# EasyEDA Pro project ProPrj_Resona_2026-08-17.epro, board ESP32-S3-N16R8_1
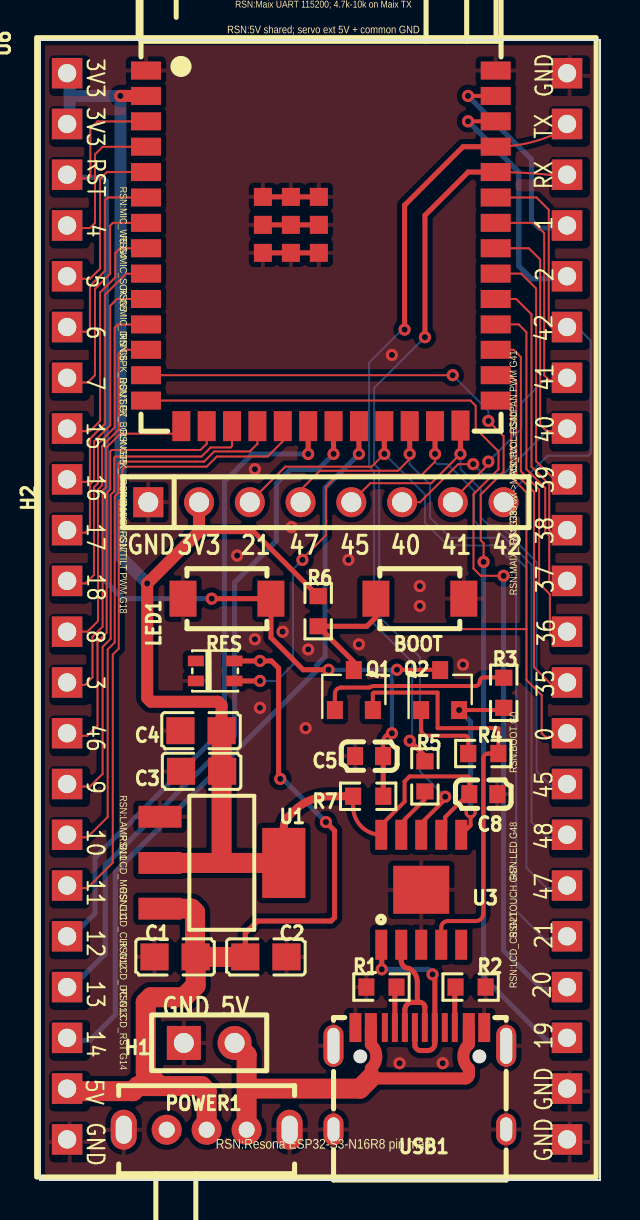
[diagram p2: board, top side]
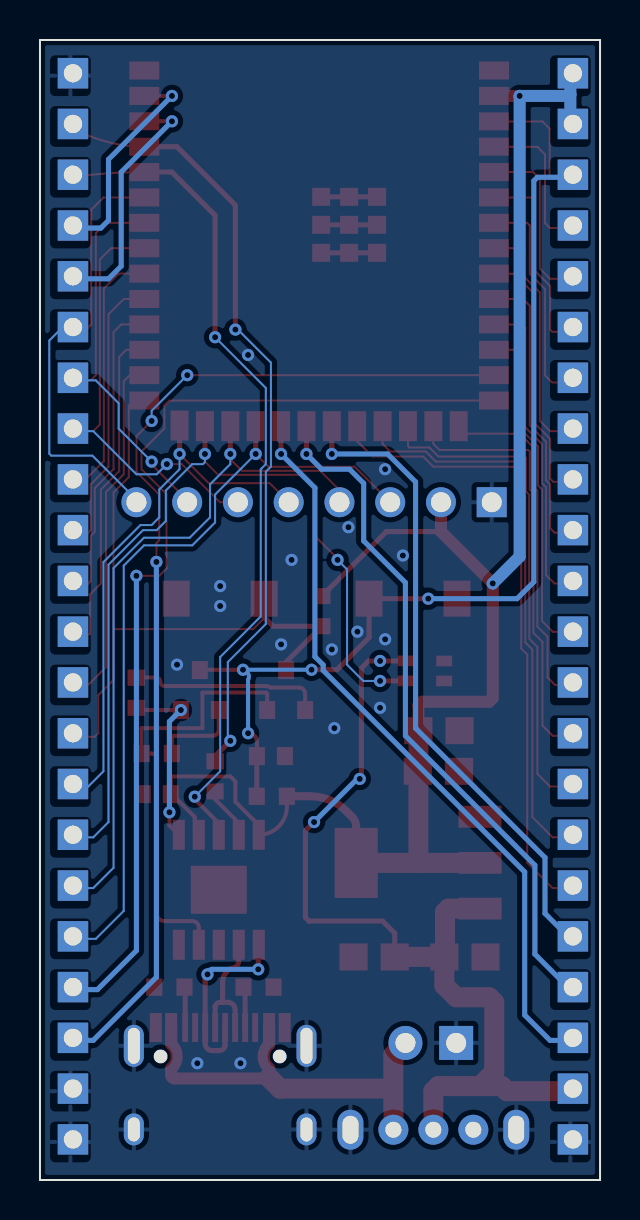
[diagram p3: board, bottom side, seen from below]

Outline 28.03 x 57.03 mm; copper layers: Top Layer, Bottom Layer. Coordinates in mm from the lower left corner of the outline.
Outline path: 0,57.03 0,0 28.03,0 28.03,57.03 0,57.03
Stack: Top Layer 0.035mm / Dielectric1 1.51mm FR4 er 4.5 / Bottom Layer 0.035mm

## Design rules (mm)
spacing copperThickness1oz (default): track to track 0.102, other pairs 0.152 to 0.3
spacing copperThickness2oz: track to track 0.203, other pairs 0.152 to 0.3
spacing Plane_innerPlane: track to track 0.102, other pairs 0.152 to 0.3
spacing Copper_copperRegion: track to track 0.102, other pairs 0.152 to 0.3
track width copperThickness1oz (default): min 0.127, default 0.254, max 2.54
track width copperThickness2oz: min 0.203, default 0.254, max 2.54
differential pair differentialPair (default): width min 0.127, default 0.254, max 2.54; gap min 0.152, default 0.152
pour e602 uses Copper_copperRegion
pour e712 uses Copper_copperRegion

## Placement (name value [footprint] x y rotation side)
BOOT  TS-KG88C-ART25F  [SW-SMD_L4.0-W2.9-LS4.8_G]  19.01 29.08 0 top
C1  10u  [C0805]  6.76 11.16 0 top
C2  104  [C0805]  11.31 11.16 180 top
C3  10u  [C0805]  8.09 20.45 0 top
C4  104  [C0805]  8.06 22.48 0 top
C5  1uF  [C0603]  16.47 21.21 180 top
C8  100nF  [C0603]  22.19 19.3 180 top
H1  -  [HDR-TH_2P-P2.54-V-F]  8.47 6.86 0 top
H2  -  [HDR-TH_8P-P2.54-V-M]  14.31 33.91 0 top
LED1  WS2812-2020  [LED-SMD_L2.2-W2.0]  8.77 25.47 180 top
POWER1  -  [SK12D07VG3]  8.34 1.02 0 top
Q1  S8050  [SOT-23]  15.71 24.51 90 top
Q2  S8050  [SOT-23]  20.03 24.51 90 top
R1  5.1kΩ  [R0603]  17.09 9.65 180 top
R2  5.1kΩ  [R0603]  21.55 9.65 0 top
R3  4.7kΩ  [R0603]  23.21 24.38 90 top
R4  4.7kΩ  [R0603]  22.19 21.34 180 top
R5  4.7kΩ  [R0603]  19.26 20.19 270 top
R6  10kΩ  [R0603]  13.92 28.46 90 top
R7  10kΩ  [R0603]  16.43 19.2 180 top
RES  TS-KG88C-ART25F  [SW-SMD_L4.0-W2.9-LS4.8_G]  9.36 29.08 180 top
U1  AMS1117-3.3  [SOT-223_L6.5-W3.5-P2.30-LS7.0-BR]  9.1 15.88 180 top
U2  ESP32-S3-WROOM-1-N16  [WIRELM-SMD_ESP32-S3-WROOM-1]  14.06 46.61 0 top
U3  CH340K  [ESOP-10_L4.9-W3.9-P1.00-LS6.2-BL-EP]  19.08 14.52 0 top
U6  -  [ESP32-S3-WROOM-1]  -0.04 57.02 270 top
USB1  -  [USB-C-SMD_TYPEC-304-BCP16]  19.01 5.08 0 top

## Footprints (pads in the part's own frame, mm; a bottom-side part is the same pattern mirrored in y, then rotated)
C0603
  rect 0.8x0.9 smd: 1(-0.7,0) 2(0.7,0)
C0805
  rect 1.41x1.35 smd: 1(-1.03,0) 2(1.03,0)
ESOP-10_L4.9-W3.9-P1.00-LS6.2-BL-EP
  rect 0.6x1.5 smd: 1(-2,-2.75) 2(-1,-2.75) 3(0,-2.75) 4(1,-2.75) 5(2,-2.75) 6(2,2.75) 7(1,2.75) 8(0,2.75) 9(-1,2.75) 10(-2,2.75)
  rect 2.8x2.4 smd: 11(0,0)
ESP32-S3-WROOM-1
  rect 1.524x1.524 hole 0.914: 1(1.651,1.397) 2(4.191,1.397) 3(6.731,1.397) 4(9.271,1.397) 5(11.811,1.397) 6(14.351,1.397) 7(16.891,1.397) 8(19.431,1.397) 9(21.971,1.397) 10(24.511,1.397) 11(27.051,1.397) 12(29.591,1.397) 13(32.131,1.397) 14(34.671,1.397) 15(37.211,1.397) 16(39.751,1.397) 17(42.291,1.397) 18(44.831,1.397) 19(47.371,1.397) 20(49.911,1.397) 21(52.451,1.397) 22(54.991,1.397) 23(54.991,26.416) 24(52.451,26.416) 25(49.911,26.416) 26(47.371,26.416) 27(44.831,26.416) 28(42.291,26.416) 29(39.751,26.416) 30(37.211,26.416) 31(34.671,26.416) 32(32.131,26.416) 33(29.591,26.416) 34(27.051,26.416) 35(24.511,26.416) 36(21.971,26.416) 37(19.431,26.416) 38(16.891,26.416) 39(14.351,26.416) 40(11.811,26.416) 41(9.271,26.416) 42(6.731,26.416) 43(4.191,26.416) 44(1.651,26.416)
HDR-TH_2P-P2.54-V-F
  rect 1.7x1.7 hole 1: 1(-1.27,0)
  round 1.7 hole 1: 2(1.27,0)
HDR-TH_8P-P2.54-V-M
  rect 1.5x1.5 hole 1: 1(-8.89,0)
  round 1.5 hole 1: 2(-6.35,0) 3(-3.81,0) 4(-1.27,0) 5(1.27,0) 6(3.81,0) 7(6.35,0) 8(8.89,0)
LED-SMD_L2.2-W2.0
  rect 0.8x0.535 smd: 1(0.965,-0.5) 2(0.965,0.5) 3(-0.965,0.5) 4(-0.965,-0.5)
R0603
  rect 0.806x0.864 smd: 1(-0.753,0) 2(0.753,0)
SK12D07VG3
  round 1.5 hole 0.8: 1(-2,1.5) 2(0,1.5) 3(2,1.5)
  oval 1.3x2 hole 0.8x1.4: 4(4.15,1.5) 5(-4.15,1.5)
SOT-23
  rect 0.9x0.8 smd: 1(-1,0.95) 2(-1,-0.95) 3(1,0)
SOT-223_L6.5-W3.5-P2.30-LS7.0-BR
  rect 2.159x1.092 smd: 1(3.099,-2.299) 2(3.099,0.013) 3(3.099,2.299)
  rect 2.159x3.505 smd: 4(-3.099,0.013)
SW-SMD_L4.0-W2.9-LS4.8_G
  rect 1.35x1.8 smd: 1(-2.2,0) 2(2.2,0)
USB-C-SMD_TYPEC-304-BCP16
  oval 1.001x2.1 hole 0.6x1.801: 13(-4.321,1.633) 14(4.321,1.633)
  oval 1.001x1.6 hole 0.6x1.199: 15(-4.321,-2.547) 16(4.321,-2.547)
  rect 0.6x1.45 smd: A1B12(-3.226,2.547) A4B9(-2.451,2.547) B1A12(3.22,2.547) B4A9(2.451,2.547)
  rect 0.299x1.45 smd: A5(-1.25,2.547) A6(-0.249,2.547) A7(0.249,2.547) A8(1.25,2.547) B5(1.75,2.547) B6(0.75,2.547) B7(-0.75,2.547) B8(-1.75,2.547)
WIRELM-SMD_ESP32-S3-WROOM-1
  rect 1.5x0.9 smd: 1(-8.75,8.895) 2(-8.75,7.625) 3(-8.75,6.355) 4(-8.75,5.085) 5(-8.75,3.815) 6(-8.75,2.545) 7(-8.75,1.275) 8(-8.75,0.005) 9(-8.75,-1.265) 10(-8.75,-2.535) 11(-8.75,-3.805) 12(-8.75,-5.075) 13(-8.75,-6.345) 14(-8.75,-7.615) 27(8.75,-7.615) 28(8.75,-6.345) 29(8.75,-5.075) 30(8.75,-3.805) 31(8.75,-2.535) 32(8.75,-1.265) 33(8.75,0.005) 34(8.75,1.275) 35(8.75,2.545) 36(8.75,3.815) 37(8.75,5.085) 38(8.75,6.355) 39(8.75,7.625) 40(8.75,8.895)
  rect 0.9x1.5 smd: 15(-6.985,-8.895) 16(-5.715,-8.895) 17(-4.445,-8.895) 18(-3.175,-8.895) 19(-1.905,-8.895) 20(-0.635,-8.895) 21(0.635,-8.895) 22(1.905,-8.895) 23(3.175,-8.895) 24(4.445,-8.895) 25(5.715,-8.895) 26(6.985,-8.865)
  rect 0.9x0.9 smd: 41(-2.9,2.575) 41(-2.9,1.175) 41(-2.9,-0.225) 41(-1.5,2.575) 41(-1.5,1.175) 41(-1.5,-0.225) 41(-0.1,2.575) 41(-0.1,1.175) 41(-0.1,-0.225)

## Nets
3V3: C3.2 C4.2 C8.2 H2.2 R6.2 R7.2 U1.2 U1.4 U2.2 U3.7 U3.10 U6.1 U6.2
5V: C1.2 C2.2 LED1.4 POWER1.2 U1.3 U6.21
GND: BOOT.2 C1.1 C2.1 C3.1 C4.1 C5.2 C8.1 H1.1 H2.1 LED1.2 POWER1.4 POWER1.5 R1.2 R2.2 RES.2 U1.1 U2.1 U2.40 U2.41 U3.3 U3.11 U6.22 U6.23 U6.24 U6.44 USB1.13 USB1.14 USB1.15 USB1.16 USB1.A1B12 USB1.B1A12
VBUS: H1.2 POWER1.3 USB1.A4B9 USB1.B4A9
340_RX: R5.2 U3.9
340_TX: U2.36 U3.8 U6.42
BOOT: BOOT.1 Q1.3 R6.1 U2.27 U6.31
CC1: R1.1 USB1.A5
CC2: R2.1 USB1.B5
D+: U3.1 USB1.A6 USB1.B6
D-: U3.2 USB1.A7 USB1.B7
DTR: Q1.2 R4.1 U3.4
EN: C5.1 Q2.3 R7.1 RES.1 U2.3 U6.3
IO1: U2.39 U6.41
IO2: U2.38 U6.40
IO3: U2.15 U6.13
IO4: U2.4 U6.4
IO5: U2.5 U6.5
IO6: U2.6 U6.6
IO7: U2.7 U6.7
IO8: U2.12 U6.12
IO9: U2.17 U6.15
IO10: U2.18 U6.16
IO11: U2.19 U6.17
IO12: U2.20 U6.18
IO13: U2.21 U6.19
IO14: U2.22 U6.20
IO15: U2.8 U6.8
IO16: U2.9 U6.9
IO17: U2.10 U6.10
IO18: U2.11 U6.11
IO19: U2.13 U6.25
IO20: U2.14 U6.26
IO21: H2.3 U2.23 U6.27
IO35: U2.28 U6.32
IO36: U2.29 U6.33
IO37: U2.30 U6.34
IO38: U2.31 U6.35
IO39: U2.32 U6.36
IO40: H2.6 U2.33 U6.37
IO41: H2.7 U2.34 U6.38
IO42: H2.8 U2.35 U6.39
IO45: H2.5 U2.26 U6.30
IO46: U2.16 U6.14
IO47: H2.4 U2.24 U6.28
IO48: LED1.3 U2.25 U6.29
RTS: Q2.2 R3.1 U3.6
U0TX: R5.1 U2.37 U6.43
$1N1380: Q2.1 R4.2
$1N1381: Q1.1 R3.2

Pads without a net: LED1 1; POWER1 1; U3 5; USB1 A8 B8

## Via types
v1: diameter 0.61, hole 0.305, Top Layer to Bottom Layer, 50 vias

## Routing (per net, layer and track width the routed paths; a pad name or vN(x,y) marks a point on that pad's centre or on a via; arc(x,y) is an arc through that point)
3V3: length 86.1
  Top Layer w0.2: R7.2 15.67,18.68 arc(16.08,17.68) U3.10 17.08,17.76 18.25,18.93 18.25,19.94 18.5,20.19 21.42,20.19 21.49,20.13 C8.2 21.42,19.3 20.28,18.16 20.28,17.47 U3.7
  Top Layer w0.254: 7.96,32.44 10.69,32.44 R6.2
  Top Layer w0.4: U1.4 12.2,17.67 arc(12.26,17.94) 12.41,18.16 12.7,18.45 arc(13.52,19.01) 14.5,19.2 R7.2
  Top Layer w0.6: C4.2 9.09,23.75 8.91,23.93 5.55,23.93 5.37,24.11 v1(5.37,29.84) 7.96,32.44 H2.2 ; U2.2 v1(4.02,54.23)
  Top Layer w1: 9.09,15.86 C4.2 ; 9.09,15.86 6.01,15.86 ; 9.09,15.86 U1.4
  Bottom Layer w0.6: 1.48,54.31 1.56,54.23 v1(4.02,54.23) 4.02,31.19 v1(5.37,29.84) ; 1.48,54.31 1.48,55.25 ; 1.48,54.31 1.48,52.7
5V: length 46.1
  Top Layer w0.254: LED1.4 v1(11.01,25.97) 11.58,25.97 11.94,25.61 11.94,20.15 v1(12.03,20.07) ; C2.2 10.28,12.35 10.88,12.95 14.57,12.95 14.75,13.13 14.75,17.47 v1(14.31,17.91)
  Top Layer w1: C2.2 C1.2 7.79,9.73 7.2,9.14 5.55,9.14 5.29,8.89 5.29,5.41 6,4.7 ; 6,4.7 4.91,4.7 4.66,4.44 1.48,4.44 ; 6,4.7 8.09,4.7 8.34,4.44 POWER1.2 ; 7.83,11.43 7.76,11.5 7.76,13.4 7.58,13.58 6.01,13.58
  Bottom Layer w0.254: v1(14.31,17.91) 12.15,20.07 v1(12.03,20.07)
GND: length 8.4
  Top Layer w0.254: U2.41 U2.41 U2.41 ; U2.41 U2.41 U2.41 ; U2.41 U2.41 U2.41
  vias: v1(9.87,31.24) v1(10.76,35.56) v1(10.76,27.05) v1(11.01,23.62) v1(12.14,27.43) v1(12.59,32.66) v1(13.3,22.61) v1(13.42,26.54) v1(15.44,31.02) v1(15.96,26.8) v1(17.61,41.28) v1(17.99,5.84) v1(19.01,29.71) v1(19.01,28.72) v1(20.15,5.84) v1(21.17,25.78)
VBUS: length 21.2
  Top Layer w0.6: USB1.B4A9 21.46,6.79 arc(21.19,6.18) 21.46,5.58 21.46,5.25 arc(21.41,5.13) 21.3,5.08 16.6,5.08 arc(16.57,5.09) 16.56,5.12 16.56,5.58 arc(16.83,6.18) 16.56,6.79 USB1.A4B9
  Top Layer w1: 10.36,4.57 16.01,4.57 16.56,5.12 ; H1.2 10.34,6.25 POWER1.3
340_RX: length 2.7
  Top Layer w0.2: U3.9 18.25,17.44 18.25,18.03 19.26,19.05 R5.2
340_TX: length 42.2
  Top Layer w0.1: U2.36 arc(24.66,50.36) 26.5,50.17
  Top Layer w0.2: U3.8 19.21,17.4 19.21,17.98 20.28,19.05 v1(20.28,19.18)
  Top Layer w0.254: v1(19.26,42.16) 19.26,48.26 21.43,50.42 U2.36
  Bottom Layer w0.1: v1(19.26,42.16) 16.72,39.62 16.72,35.81 16.98,35.56 16.98,28.19 19.01,26.16 19.01,20.45 v1(20.28,19.18)
BOOT: length 34.1
  Top Layer w0.1: 24.34,27.56 24.34,25.02 25.11,24.26 25.11,22.35 25.29,22.17 26.45,22.17 26.5,22.22 ; 24.34,27.56 17.36,27.56 16.81,28.11 ; 24.34,27.56 24.34,34.4 23.58,35.17 23.58,38.73 23.32,38.99 U2.27
  Top Layer w0.254: BOOT.1 16.81,28.15 16.36,27.7 R6.1 15.71,25.92 Q1.3
CC1: length 2.1
  Top Layer w0.254: USB1.A5 17.76,9.57 arc(17.78,9.63) R1.1
CC2: length 2
  Top Layer w0.254: USB1.B5 20.76,9.62 arc(20.77,9.64) R2.1
D+: length 9.7
  Top Layer w0.254: v1(17.11,10.54) 17.11,11.75 arc(17.1,11.76) U3.1 ; 18.76,7.63 18.76,6.76 arc(18.85,6.56) 19.05,6.48 19.41,6.48 arc(19.66,6.58) 19.76,6.82 USB1.B6 19.76,10.17 arc(19.73,10.25) v1(19.65,10.29)
  Bottom Layer w0.254: v1(17.11,10.54) 19.39,10.54 arc(19.57,10.47) v1(19.65,10.29)
D-: length 6.6
  Top Layer w0.254: USB1.B7 18.26,8.52 arc(18.37,8.78) 18.63,8.89 18.89,8.89 ; 18.89,8.89 18.89,9.9 arc(18.77,10.3) 18.47,10.59 arc(18.35,10.6) 18.24,10.66 arc(18.12,10.8) 18.08,10.97 U3.2 ; 18.89,8.89 19.01,8.89 arc(19.17,8.83) 19.26,8.69 ; USB1.A7 19.26,8.69 ; 19.26,8.69 arc(19.26,8.66) 19.26,8.64
DTR: length 22.2
  Top Layer w0.2: U3.4 20.08,12.63 arc(20.18,12.86) 20.41,12.95 21.8,12.95 arc(22.07,13.07) 22.19,13.33 22.19,21.08 arc(22.26,21.26) 22.44,21.34 R4.1 arc(22.95,21.34) 22.95,21.34 22.95,22.61 19.9,22.61 19.9,24.38 16.72,24.38 arc(16.68,24.36) 16.66,24.32 Q1.2
EN: length 54.8
  Top Layer w0.1: U2.3 5.3,52.96 2.88,52.96 2.52,52.6 2.52,50.21 2.42,50.11 1.54,50.11 1.48,50.17
  Top Layer w0.2: v1(17.87,25.53) 20.01,25.53 arc(20.02,25.52) Q2.3 ; C5.1 17.17,21.91 arc(17.3,22.22) v1(17.61,22.35)
  Top Layer w0.254: v1(14.44,25.53) 13.17,25.53 11.56,27.14 RES.1 v1(8.6,29.08) ; 17.18,19.2 17.18,21.2 arc(17.18,21.21) C5.1
  Bottom Layer w0.2: v1(17.61,22.35) 17.61,25.02 arc(17.61,25.34) v1(17.87,25.53) v1(14.44,25.53)
  Bottom Layer w0.254: 1.48,50.17 3.14,50.17 3.31,49.99 3.31,29.92 4.15,29.08 v1(8.6,29.08)
IO1: length 11
  Top Layer w0.2: U2.39 v1(21.42,54.23)
  Bottom Layer w0.254: 26.5,47.62 24.98,47.62 24.6,48.01 24.6,51.06 v1(21.42,54.23)
IO2: length 12.5
  Top Layer w0.2: U2.38 v1(21.42,52.96)
  Bottom Layer w0.254: 26.5,45.08 24.6,45.08 23.96,45.72 23.96,50.42 v1(21.42,52.96)
IO3: length 17.3
  Top Layer w0.1: U2.15 6.7,37.34 4.02,37.34 3.31,36.62 3.31,34.66 3.14,34.49 3.14,27.69 2.63,27.18 2.63,25.15 2.25,24.77 1.48,24.77
IO4: length 7.5
  Top Layer w0.1: 1.48,47.62 2.5,47.62 2.75,47.88 2.75,51.31 3.14,51.69 5.3,51.69 U2.4
IO5: length 8.7
  Top Layer w0.1: U2.5 3.35,50.42 3.01,50.08 3.01,45.59 2.5,45.08 1.48,45.08
IO6: length 10
  Top Layer w0.1: U2.6 3.39,49.15 3.26,49.02 3.26,45.49 2.5,44.73 2.5,42.55 2.39,42.44 1.59,42.44 1.48,42.55
IO7: length 11.1
  Top Layer w0.1: U2.7 3.65,47.88 3.51,47.75 3.51,45.33 2.75,44.58 2.75,40.26 2.39,39.9 1.59,39.9 1.48,40
IO8: length 16.9
  Top Layer w0.1: 1.48,27.31 1.61,27.43 2.37,27.43 2.9,27.96 2.9,34.54 3.11,34.75 3.11,36.71 3.94,37.54 3.94,41.32 4.16,41.53 U2.12
IO9: length 25.1
  Top Layer w0.1: 1.48,19.69 2.5,19.69 3.14,20.32 3.14,26.67 3.54,27.07 3.54,34.28 3.72,34.46 3.72,36.14 3.77,36.19 8.09,36.19 8.54,36.65 9.54,36.65 9.61,36.72 U2.17
IO10: length 28.5
  Top Layer w0.1: U2.18 10.88,36.83 10.5,36.45 8.72,36.45 8.2,35.92 8.18,35.94 4.02,35.94 3.92,35.84 3.92,34.38 3.74,34.2 3.74,26.89 3.39,26.54 3.39,18.16 2.37,17.14 1.48,17.14
IO11: length 31.9
  Top Layer w0.1: U2.19 12.15,36.96 11.39,36.19 8.85,36.19 8.34,35.69 4.28,35.69 4.12,35.53 4.12,34.13 3.94,33.95 3.94,26.59 3.64,26.29 3.64,15.88 2.37,14.61 1.48,14.61
IO12: length 32.2
  Top Layer w0.254: U2.20 v1(13.42,36.32)
  Bottom Layer w0.254: v1(13.42,36.32) 10.63,36.32 9.23,34.92 9.23,22.61 2.75,16.13 2.75,13.33 1.48,12.06
IO13: length 34.5
  Top Layer w0.254: U2.21 v1(14.69,36.32)
  Bottom Layer w0.254: 1.48,9.53 3.26,11.3 3.26,15.75 9.74,22.22 9.74,29.89 11.83,31.98 11.83,34.86 12.53,35.56 13.93,35.56 v1(14.69,36.32)
IO14: length 37.3
  Top Layer w0.254: U2.22 v1(15.96,36.32)
  Bottom Layer w0.254: 1.48,6.98 2.5,6.98 3.77,8.25 3.77,15.41 13.85,25.49 13.85,25.77 14.27,26.18 14.27,34.63 v1(15.96,36.32)
IO15: length 12.1
  Top Layer w0.1: 1.48,37.47 2.5,37.47 3.01,37.97 3.01,44.4 3.77,45.16 3.77,46.38 4,46.61 U2.8
IO16: length 13.1
  Top Layer w0.1: 1.48,34.92 2.34,34.92 2.5,35.09 2.5,37.08 3.26,37.85 3.26,44.3 4.31,45.34 5.3,45.34 U2.9
IO17: length 14.6
  Top Layer w0.1: U2.10 3.85,44.07 3.52,43.74 3.52,37.75 2.7,36.94 2.7,35 2.5,34.8 2.5,32.61 2.28,32.39 1.48,32.39
IO18: length 15.8
  Top Layer w0.1: U2.11 5.3,42.8 3.9,42.8 3.74,42.64 3.74,37.65 2.9,36.82 2.9,34.86 2.7,34.66 2.7,30.27 2.28,29.84 1.48,29.84
IO19: length 52.7
  Top Layer w0.1: v1(22.2,30.92) 22.2,31.86 22.06,32 22.06,34.29 23.2,35.43 23.2,37.21 v1(22.44,37.97) ; U2.13 v1(20.66,40.26)
  Bottom Layer w0.1: v1(22.44,37.97) 22.44,38.48 v1(20.66,40.26)
  Bottom Layer w0.254: 26.5,6.98 25.36,6.98 22.2,10.15 v1(22.2,30.92)
IO20: length 50.3
  Top Layer w0.1: U2.14 21.55,38.99 21.8,38.73 21.8,37.59 22.95,36.45 22.95,35.56 21.69,34.31 21.69,30.59 22.06,30.23 v1(23.2,30.23)
  Bottom Layer w0.254: 26.5,9.53 25.15,9.53 23.2,11.48 v1(23.2,30.23)
IO21: length 39.4
  Top Layer w0.1: H2.3 12.28,35.69 16.6,35.69 v1(17.23,36.32)
  Top Layer w0.254: U2.23 v1(17.23,36.32)
  Bottom Layer w0.1: v1(17.23,36.32) 19.26,34.29 19.26,32.89 20.41,31.75 22.82,31.75 23.84,30.73 23.84,13.46 25.23,12.06 26.5,12.06
IO35: length 18
  Top Layer w0.1: U2.28 23.53,40.26 23.84,39.95 23.84,35.31 24.73,34.42 24.73,25.65 25.61,24.77 26.5,24.77
IO36: length 16.9
  Top Layer w0.1: 26.5,27.31 25.52,27.31 25.52,29.31 24.98,29.84 24.98,34.54 24.07,35.46 24.07,41.17 23.7,41.53 U2.29
IO37: length 15.7
  Top Layer w0.1: U2.30 23.96,42.8 24.34,42.42 24.34,35.56 25.29,34.62 25.29,32.43 25.49,32.23 25.49,29.96 25.61,29.84 26.5,29.84
IO38: length 14.3
  Top Layer w0.1: 26.5,32.39 25.61,32.39 25.49,32.51 25.49,34.8 24.6,35.69 24.6,43.31 23.83,44.07 U2.31
IO39: length 13.1
  Top Layer w0.1: 26.5,34.92 25.87,34.92 24.83,35.96 24.83,44.6 24.09,45.34 U2.32
IO40: length 22.6
  Top Layer w0.1: v1(21.68,35.81) 20.93,35.81 19.02,33.91 H2.6 ; 26.5,37.47 25.36,37.47 25.03,37.79 25.03,46.05 24.47,46.61 U2.33
  Bottom Layer w0.1: v1(21.68,35.81) 22.19,35.31 23.2,35.31 25.36,37.47 26.5,37.47
IO41: length 20.4
  Top Layer w0.1: v1(22.44,35.94) 22.44,35.8 20.66,34.02 H2.7 ; 26.5,40 25.49,40 25.23,40.26 25.23,47.37 24.72,47.88 U2.34
  Bottom Layer w0.1: 26.5,40 25.23,40 24.09,38.86 24.09,37.59 v1(22.44,35.94)
IO42: length 22.2
  Top Layer w0.1: 26.5,42.55 25.72,42.55 25.46,42.8 25.46,48.54 24.85,49.15 U2.35
  Bottom Layer w0.1: H2.8 23.2,34.04 25.4,36.24 27.46,36.24 27.56,36.34 27.56,42 27.01,42.55 26.5,42.55
IO45: length 27.6
  Top Layer w0.1: v1(21.04,36.32) 19.58,34.86 16.53,34.86 H2.5
  Top Layer w0.254: U2.26 v1(21.04,36.32)
  Bottom Layer w0.1: 26.5,19.69 25.61,19.69 24.85,20.45 24.85,30.91 23,32.77 22.44,32.77 22.06,33.15 22.06,34.54 21.04,35.56 v1(21.04,36.32)
IO46: length 21.5
  Top Layer w0.1: 1.48,22.22 2.37,22.22 2.88,22.73 2.88,26.92 3.34,27.38 3.34,34.36 3.52,34.54 3.52,36.45 3.59,36.52 8.03,36.52 8.34,36.83 U2.16
IO47: length 35.4
  Top Layer w0.1: H2.4 13.04,34.52 14.01,35.48 17.92,35.48 18.5,36.07 v1(18.5,36.32)
  Top Layer w0.254: U2.24 v1(18.5,36.32)
  Bottom Layer w0.1: v1(18.5,36.32) 18.5,35.81 19.52,34.8 19.52,33.15 20.53,32.13 22.83,32.13 24.34,30.61 24.34,15.62 25.36,14.61 26.5,14.61
IO48: length 43.9
  Top Layer w0.1: v1(19.77,36.32) 19.77,35.94 19.11,35.28 14.92,35.28 14.31,34.67 14.31,32.26 13.13,31.08 v1(13.13,31.02)
  Top Layer w0.254: LED1.3 v1(11.01,24.97) ; U2.25 v1(19.77,36.32)
  Bottom Layer w0.1: v1(13.13,31.02) 12.66,30.55 12.66,25.78 11.85,24.97 v1(11.01,24.97) ; 26.5,17.14 25.36,17.14 24.6,17.91 24.6,30.78 22.87,32.51 22.19,32.51 21.73,32.97 21.73,34.49 20.41,35.81 19.87,35.81 19.77,35.91 v1(19.77,36.32)
RTS: length 8.8
  Top Layer w0.2: U3.6 21.55,17.74 v1(21.55,18.4) ; v1(20.98,23.51) 23.1,23.51
  Bottom Layer w0.254: v1(20.98,23.51) 21.55,22.94 v1(21.55,18.4)
U0TX: length 39.5
  Top Layer w0.1: U2.37 arc(24.72,51.95) 26.5,52.7
  Top Layer w0.254: v1(18.25,42.55) 18.25,48.77 21.17,51.69 U2.37 ; v1(18.5,21.97) 19.26,21.21 R5.1
  Bottom Layer w0.1: v1(18.25,42.55) 18.12,42.55 16.47,40.89 16.47,35.69 16.72,35.43 16.72,27.81 18.63,25.91 18.63,22.1 v1(18.5,21.97)
$1N1380: length 4.3
  Top Layer w0.2: R4.2 21.43,22.09 arc(21.39,22.19) 21.3,22.22 19.39,22.22 arc(19.17,22.32) 19.08,22.54 Q2.1
$1N1381: length 9.7
  Top Layer w0.2: Q1.1 14.76,24.32 arc(14.85,24.55) 15.07,24.64 16.49,24.64 arc(16.6,24.69) 16.72,24.71 21.79,24.71 arc(21.95,24.78) 22.01,24.93 arc(22.02,24.99) 22.05,25.06 arc(22.13,25.12) 22.23,25.15 23.19,25.15 arc(23.21,25.14) R3.2

## Copper pours and planes (outline as drawn; the poured copper is in the pictures)
GND on Top Layer: -12.36,57.91 28.15,57.91 28.15,-3.81 -12.36,-3.81
GND on Bottom Layer: -3.98,57.02 35.01,57.02 35.01,-0.13 -3.98,-0.13

## Text on the board
Top Silkscreen Layer: 20 | TX | RX | 1 | 42 | 45 | 48 | 47 | 21 | GND | 19 | 2 | 41 | 38 | 0 | 37 | 40 | 39 | 35 | 36 | 5V | 5 | 15 | 8 | 3V3 | 4 | 6 | 7 | 17 | 3 | 46 | 9 | 10 | 11 | 12 | 13 | 14 | 16 | 18 | RST | RSN:Maix UART 115200; 4.7k-10k on Maix TX | RSN:PAN PWM G41 | RSN:VOL+ G40 | RSN:G39 TX->MAIX_RX | RSN:MAIX_TX->G38 RX | RSN:BOOT G0 | RSN:LED G48 | RSN:TOUCH G47 | RSN:LCD_CS G21 | RSN:MIC_WS G4 | RSN:MIC_SCK G5 | RSN:MIC_DIN G6 | RSN:SPK_DOUT G7 | RSN:SPK_BCLK G15 | RSN:SPK_LRCK G16 | RSN:VOL- G17 | RSN:TILT PWM G18 | RSN:LAMP G10 | RSN:LCD_MOSI G11 | RSN:LCD_CLK G12 | RSN:LCD_DC G13 | RSN:LCD_RST G14 | RSN:5V shared; servo ext 5V + common GND | RSN:Resona ESP32-S3-N16R8 pin map
